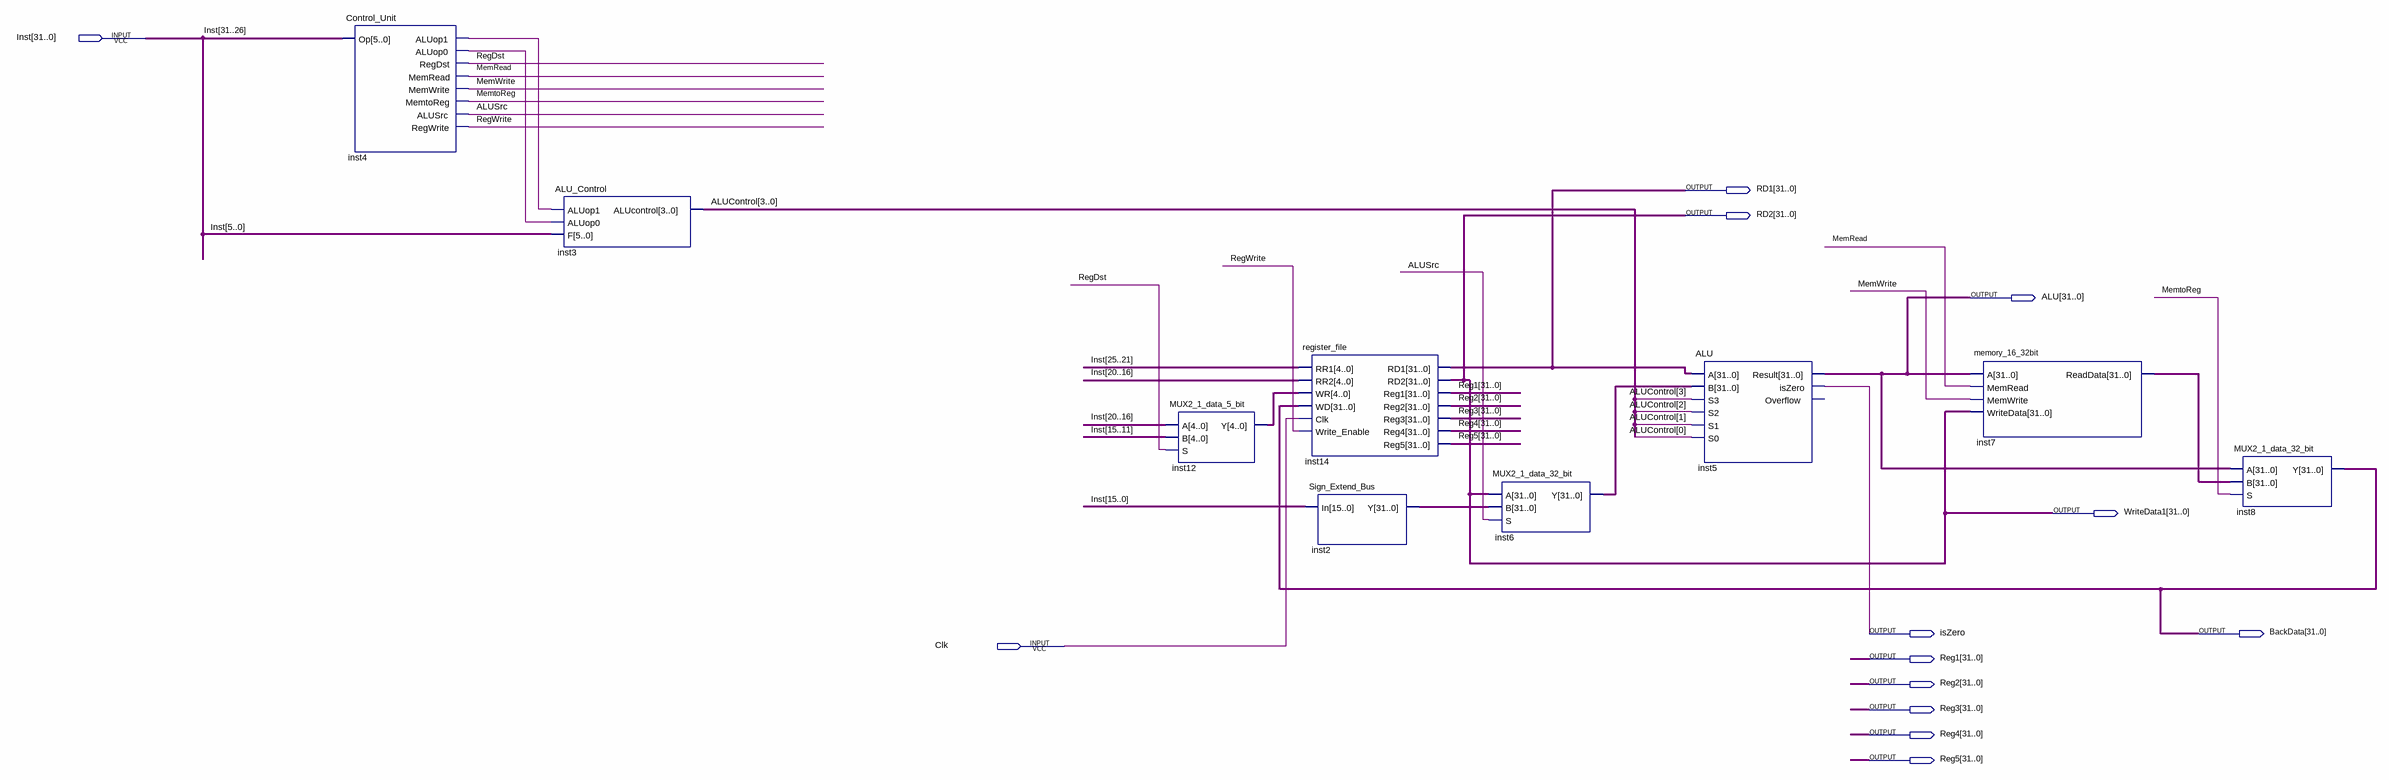
[diagram p0: schematic sheet]
// Quartus schematic cau01_test_control.bdf as structural Verilog: 9 symbols, 13 pins
module cau01_test_control (
  input  [31:0] Inst,
  input  Clk,
  output [31:0] RD1,
  output [31:0] RD2,
  output [31:0] ALU,
  output [31:0] WriteData1,
  output isZero,
  output [31:0] BackData,
  output [31:0] Reg1,
  output [31:0] Reg2,
  output [31:0] Reg3,
  output [31:0] Reg4,
  output [31:0] Reg5
);

  wire ALUSrc, inst4_aluop0, inst4_aluop1, MemRead, MemtoReg, MemWrite, RegDst, RegWrite;
  wire [3:0] ALUControl;
  wire [4:0] inst12_y;
  wire [31:0] inst2_y, inst6_y, inst7_readdata;

  Control_Unit inst4 (
    .Op(Inst[31:26]), .ALUop1(inst4_aluop1), .ALUop0(inst4_aluop0), .RegDst(RegDst), .MemRead(MemRead),
    .MemWrite(MemWrite), .MemtoReg(MemtoReg), .ALUSrc(ALUSrc), .RegWrite(RegWrite));
  ALU_Control inst3 (.ALUop1(inst4_aluop1), .ALUop0(inst4_aluop0), .F(Inst[5:0]), .ALUcontrol(ALUControl));
  MUX2_1_data_5_bit inst12 (.A(Inst[20:16]), .B(Inst[15:11]), .S(RegDst), .Y(inst12_y));
  register_file inst14 (
    .WD(BackData), .RR1(Inst[25:21]), .RR2(Inst[20:16]), .WR(inst12_y), .Clk(Clk), .Write_Enable(RegWrite),
    .RD1(RD1), .RD2(RD2), .Reg1(Reg1), .Reg2(Reg2), .Reg3(Reg3), .Reg4(Reg4), .Reg5(Reg5));
  Sign_Extend_Bus inst2 (.In(Inst[15:0]), .Y(inst2_y));
  MUX2_1_data_32_bit inst6 (.A(RD2), .B(inst2_y), .S(ALUSrc), .Y(inst6_y));
  ALU inst5 (
    .A(RD1), .B(inst6_y), .S3(ALUControl[3]), .S2(ALUControl[2]), .S1(ALUControl[1]), .S0(ALUControl[0]),
    .Result(ALU), .isZero(isZero));  // open: Overflow
  memory_16_32bit inst7 (.WriteData(RD2), .A(ALU), .MemRead(MemRead), .MemWrite(MemWrite), .ReadData(inst7_readdata));
  MUX2_1_data_32_bit inst8 (.A(ALU), .B(inst7_readdata), .S(MemtoReg), .Y(BackData));

  assign WriteData1 = RD2;
endmodule
